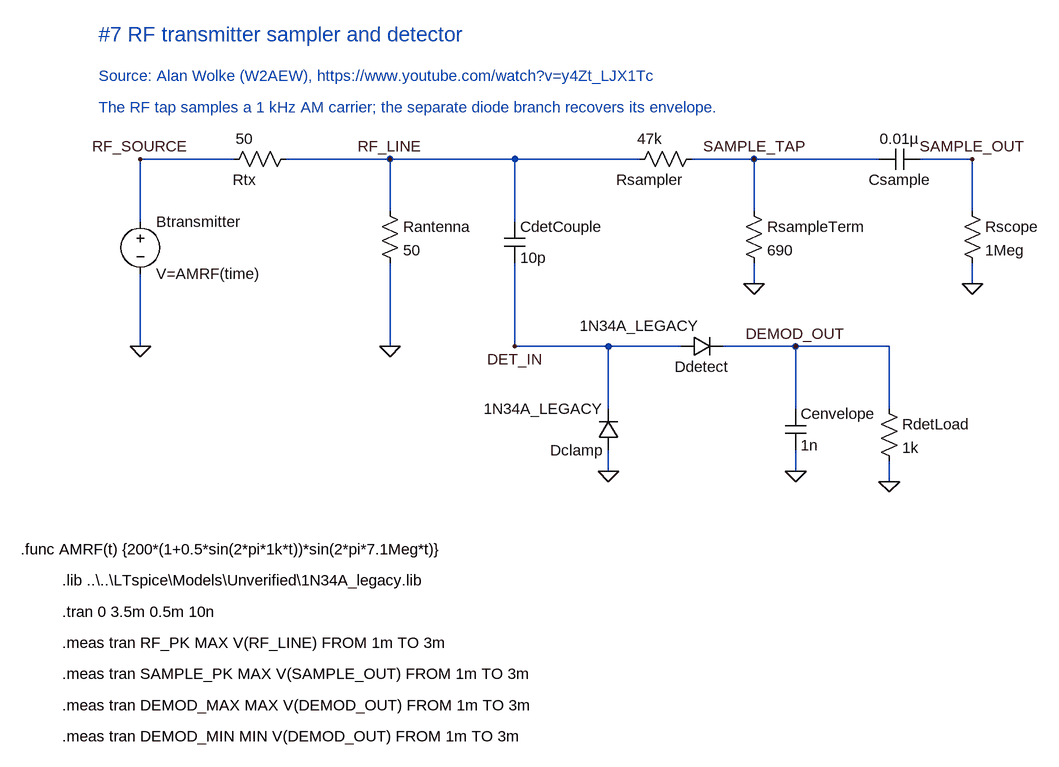
[diagram p0: schematic RF transmitter sampler and detector.asc]
RF transmitter sampler and detector.asc, the LTspice schematic file:
Version 4.1
SHEET 1 2560 1200
WIRE 208 -80 64 -80
WIRE 448 -80 288 -80
WIRE 640 -80 448 -80
WIRE 832 -80 640 -80
WIRE 1008 -80 912 -80
WIRE 1200 -80 1008 -80
WIRE 1344 -80 1264 -80
WIRE 448 0 448 -80
WIRE 1008 0 1008 -80
WIRE 1344 0 1344 -80
WIRE 64 16 64 -80
WIRE 640 16 640 -80
WIRE 1008 112 1008 80
WIRE 1344 112 1344 80
WIRE 64 208 64 96
WIRE 448 208 448 80
WIRE 640 208 640 80
WIRE 784 208 640 208
WIRE 896 208 784 208
WIRE 1072 208 960 208
WIRE 1216 208 1072 208
WIRE 784 304 784 208
WIRE 1072 304 1072 208
WIRE 1216 304 1216 208
WIRE 784 400 784 368
WIRE 1072 400 1072 368
WIRE 1216 416 1216 384
FLAG 64 -80 RF_SOURCE
FLAG 64 208 0
FLAG 448 -80 RF_LINE
FLAG 448 208 0
FLAG 640 208 DET_IN
FLAG 784 400 0
FLAG 1072 208 DEMOD_OUT
FLAG 1072 400 0
FLAG 1216 416 0
FLAG 1008 -80 SAMPLE_TAP
FLAG 1008 112 0
FLAG 1344 -80 SAMPLE_OUT
FLAG 1344 112 0
SYMBOL voltage 64 0 R0
SYMATTR Prefix B
SYMATTR InstName Btransmitter
SYMATTR Value V=AMRF(time)
SYMBOL res 192 -64 R270
WINDOW 0 0 32 VBottom 2
WINDOW 3 32 32 VTop 2
SYMATTR InstName Rtx
SYMATTR Value 50
SYMBOL res 432 -16 R0
SYMATTR InstName Rantenna
SYMATTR Value 50
SYMBOL cap 624 16 R0
SYMATTR InstName CdetCouple
SYMATTR Value 10p
SYMBOL diode 800 368 R180
SYMATTR InstName Dclamp
SYMATTR Value 1N34A_LEGACY
SYMBOL diode 896 224 R270
WINDOW 0 0 32 VBottom 2
WINDOW 3 32 -64 VTop 2
SYMATTR InstName Ddetect
SYMATTR Value 1N34A_LEGACY
SYMBOL cap 1056 304 R0
SYMATTR InstName Cenvelope
SYMATTR Value 1n
SYMBOL res 1200 288 R0
SYMATTR InstName RdetLoad
SYMATTR Value 1k
SYMBOL res 816 -64 R270
WINDOW 0 0 32 VBottom 2
WINDOW 3 32 32 VTop 2
SYMATTR InstName Rsampler
SYMATTR Value 47k
SYMBOL res 992 -16 R0
SYMATTR InstName RsampleTerm
SYMATTR Value 690
SYMBOL cap 1200 -64 R270
WINDOW 0 0 32 VBottom 2
WINDOW 3 32 32 VTop 2
SYMATTR InstName Csample
SYMATTR Value 0.01µ
SYMBOL res 1328 -16 R0
SYMATTR InstName Rscope
SYMATTR Value 1Meg
TEXT -120 520 Left 2 !.func AMRF(t) {200*(1+0.5*sin(2*pi*1k*t))*sin(2*pi*7.1Meg*t)}
TEXT -56 568 Left 2 !.lib ..\..\LTspice\Models\Unverified\1N34A_legacy.lib
TEXT -56 616 Left 2 !.tran 0 3.5m 0.5m 10n
TEXT -56 664 Left 2 !.meas tran RF_PK MAX V(RF_LINE) FROM 1m TO 3m
TEXT -56 712 Left 2 !.meas tran SAMPLE_PK MAX V(SAMPLE_OUT) FROM 1m TO 3m
TEXT -56 760 Left 2 !.meas tran DEMOD_MAX MAX V(DEMOD_OUT) FROM 1m TO 3m
TEXT -56 808 Left 2 !.meas tran DEMOD_MIN MIN V(DEMOD_OUT) FROM 1m TO 3m
TEXT 0 -272 Left 3 ;#7 RF transmitter sampler and detector
TEXT 0 -208 Left 2 ;Source: Alan Wolke (W2AEW), https://www.youtube.com/watch?v=y4Zt_LJX1Tc
TEXT 0 -160 Left 2 ;The RF tap samples a 1 kHz AM carrier; the separate diode branch recovers its envelope.

The netlist it stands for:
* RF transmitter sampler and detector.asc
Btransmitter RF_SOURCE 0 V=AMRF(time)
Rtx RF_SOURCE RF_LINE 50
Rantenna RF_LINE 0 50
CdetCouple RF_LINE DET_IN 10p
Dclamp 0 DET_IN 1N34A_LEGACY
Ddetect DET_IN DEMOD_OUT 1N34A_LEGACY
Cenvelope DEMOD_OUT 0 1n
RdetLoad DEMOD_OUT 0 1k
Rsampler RF_LINE SAMPLE_TAP 47k
RsampleTerm SAMPLE_TAP 0 690
Csample SAMPLE_TAP SAMPLE_OUT 0.01µ
Rscope SAMPLE_OUT 0 1Meg
.model D D
.lib standard.dio
.func AMRF(t) {200*(1+0.5*sin(2*pi*1k*t))*sin(2*pi*7.1Meg*t)}
.lib ..\..\LTspice\Models\Unverified\1N34A_legacy.lib
.tran 0 3.5m 0.5m 10n
.meas tran RF_PK MAX V(RF_LINE) FROM 1m TO 3m
.meas tran SAMPLE_PK MAX V(SAMPLE_OUT) FROM 1m TO 3m
.meas tran DEMOD_MAX MAX V(DEMOD_OUT) FROM 1m TO 3m
.meas tran DEMOD_MIN MIN V(DEMOD_OUT) FROM 1m TO 3m
* #7 RF transmitter sampler and detector
* Source: Alan Wolke (W2AEW), https://www.youtube.com/watch?v=y4Zt_LJX1Tc
* The RF tap samples a 1 kHz AM carrier; the separate diode branch recovers its envelope.
.backanno
.end